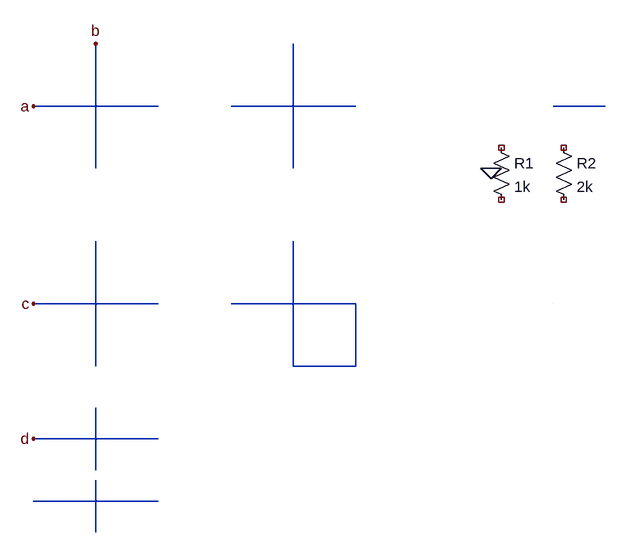
[diagram p0: schematic every_kind.asc]
every_kind.asc, the LTspice schematic file:
Version 4
SHEET 1 1040 880
WIRE 192 96 0 96
WIRE 96 192 96 0
WIRE 192 400 0 400
WIRE 96 496 96 304
WIRE 496 96 304 96
WIRE 400 192 400 0
WIRE 496 400 304 400
WIRE 400 496 400 304
WIRE 496 496 496 400
WIRE 496 496 400 496
WIRE 192 608 0 608
WIRE 96 656 96 560
WIRE 192 704 0 704
WIRE 96 752 96 672
WIRE 880 96 800 96
WIRE 800 400 800 400
FLAG 0 96 a
FLAG 96 0 b
FLAG 0 400 c
FLAG 0 608 d
FLAG 704 192 0
SYMBOL res 704 144 R0
SYMATTR InstName R1
SYMATTR Value 1k
SYMBOL res 800 144 R0
SYMATTR InstName R2
SYMATTR Value 2k

The netlist it stands for:
* every_kind.asc
R1 NC_01 NC_02 1k
R2 NC_03 NC_04 2k
.backanno
.end